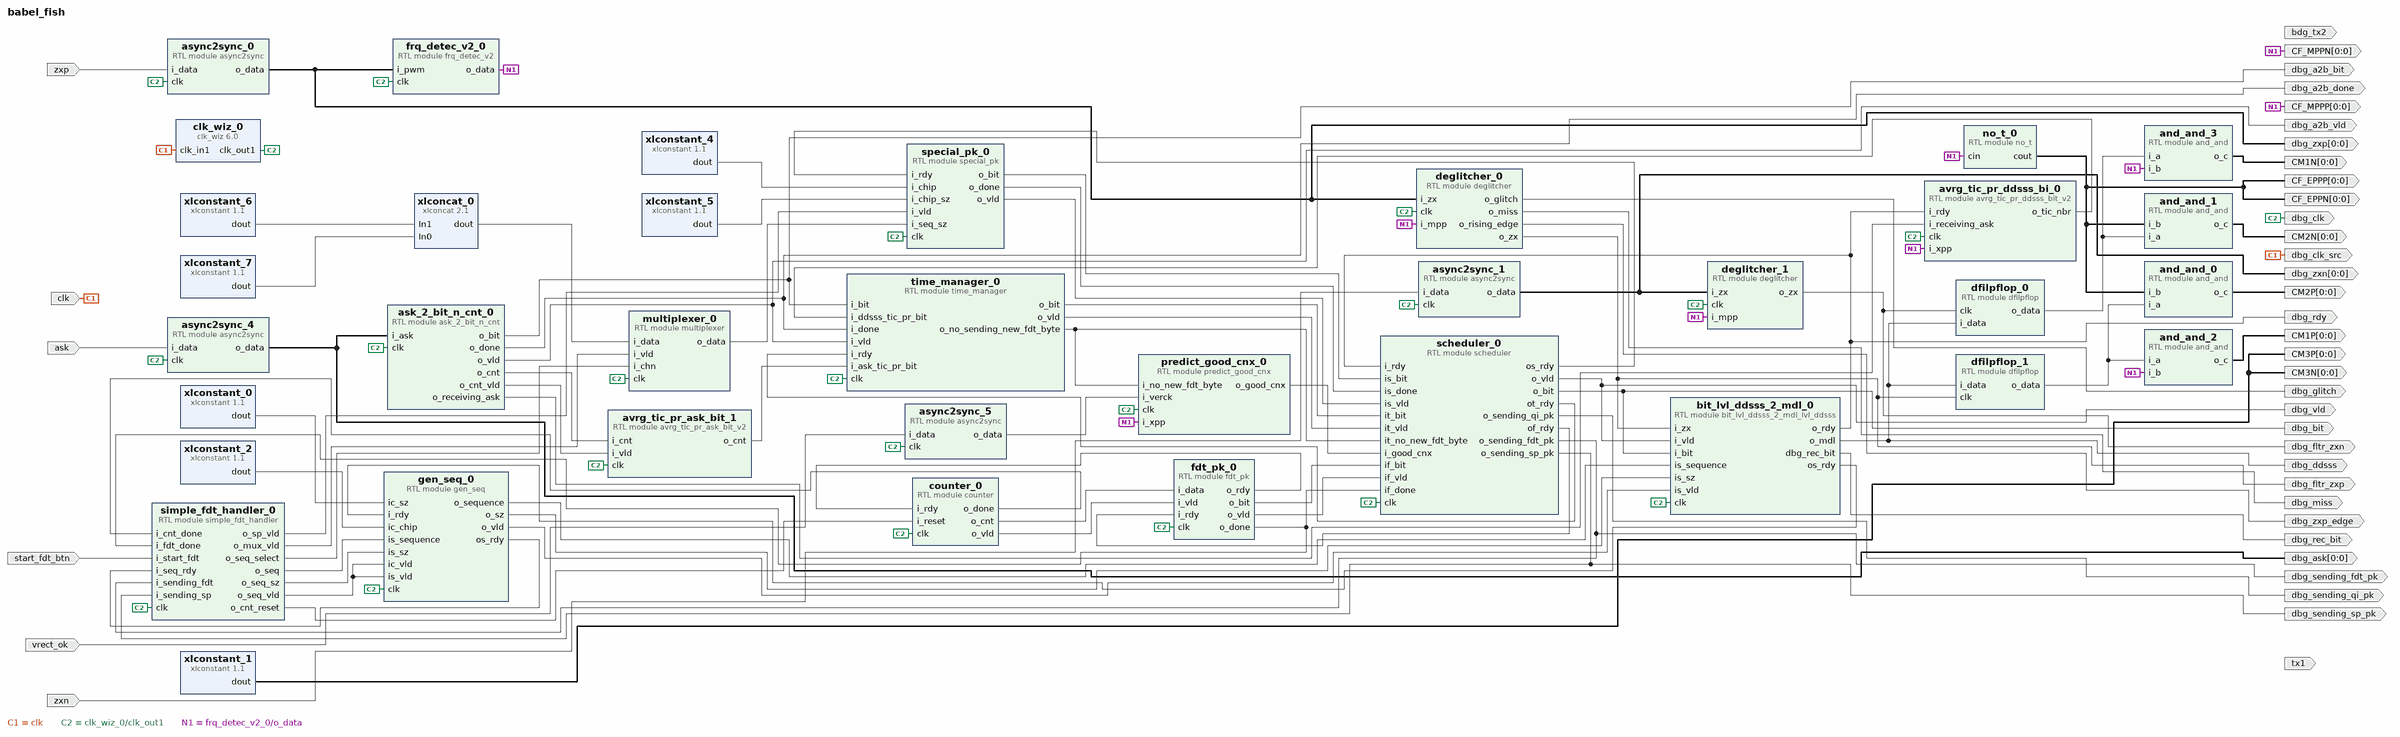
[diagram p0: block diagram of the top level]
# Vivado block design babel_fish, xc7a35tcpg236-1, Vivado 2021.1
create_bd_design babel_fish

create_bd_port -dir I -type clk clk
set_property -dict {CONFIG.FREQ_HZ 12000000} [get_bd_ports clk]
create_bd_port -dir I -type data ask
create_bd_port -dir I -type data zxn
create_bd_port -dir I -type data zxp
create_bd_port -dir O -from 0 -to 0 -type data CF_EPPN
create_bd_port -dir O -from 0 -to 0 -type data CF_MPPN
create_bd_port -dir O -from 0 -to 0 -type data CF_EPPP
create_bd_port -dir O -from 0 -to 0 -type data CF_MPPP
create_bd_port -dir O -from 0 -to 0 -type data CM3N
create_bd_port -dir O -from 0 -to 0 -type data CM2N
create_bd_port -dir O -from 0 -to 0 -type data CM1N
create_bd_port -dir O -from 0 -to 0 -type data CM3P
create_bd_port -dir O -from 0 -to 0 -type data CM2P
create_bd_port -dir O -from 0 -to 0 -type data CM1P
create_bd_port -dir O -type data dbg_ddsss
create_bd_port -dir O -type data dbg_bit
create_bd_port -dir O -type data dbg_vld
create_bd_port -dir O -type data dbg_clk
create_bd_port -dir O -from 0 -to 0 -type data dbg_ask
create_bd_port -dir O -type data dbg_clk_src
create_bd_port -dir O -from 0 -to 0 -type data dbg_zxp
create_bd_port -dir O -from 0 -to 0 -type data dbg_zxn
create_bd_port -dir O -type data dbg_rec_bit
create_bd_port -dir O -type data dbg_rdy
create_bd_port -dir O -type data dbg_fltr_zxp
create_bd_port -dir O -type data dbg_fltr_zxn
create_bd_port -dir O -type data dbg_glitch
create_bd_port -dir O -type data dbg_miss
create_bd_port -dir O -type data dbg_zxp_edge
create_bd_port -dir O -type data dbg_a2b_vld
create_bd_port -dir O -type data dbg_a2b_bit
create_bd_port -dir O -type data dbg_a2b_done
create_bd_port -dir O -type data tx1
create_bd_port -dir O -type data bdg_tx2
create_bd_port -dir I -type data vrect_ok
create_bd_port -dir I -type data start_fdt_btn
create_bd_port -dir O -type data dbg_sending_qi_pk
create_bd_port -dir O -type data dbg_sending_sp_pk
create_bd_port -dir O -type data dbg_sending_fdt_pk

create_bd_cell -type ip -vlnv xilinx.com:ip:clk_wiz:6.0 clk_wiz_0
set_property -dict [list \
  CONFIG.CLKIN1_JITTER_PS 833.33 \
  CONFIG.CLKOUT1_JITTER 479.872 \
  CONFIG.CLKOUT1_PHASE_ERROR 668.310 \
  CONFIG.MMCM_CLKFBOUT_MULT_F 62.500 \
  CONFIG.MMCM_CLKIN1_PERIOD 83.333 \
  CONFIG.MMCM_CLKIN2_PERIOD 10.0 \
  CONFIG.MMCM_CLKOUT0_DIVIDE_F 7.500 \
  CONFIG.PRIM_IN_FREQ 12 \
  CONFIG.USE_LOCKED false \
  CONFIG.USE_RESET false \
] [get_bd_cells clk_wiz_0]
create_bd_cell -type ip -vlnv xilinx.com:ip:xlconstant:1.1 xlconstant_1
set_property -dict {CONFIG.CONST_VAL 0} [get_bd_cells xlconstant_1]
create_bd_cell -type module -reference async2sync async2sync_0
set_property -dict {CONFIG.sync_level 5} [get_bd_cells async2sync_0]
create_bd_cell -type module -reference async2sync async2sync_1
set_property -dict {CONFIG.sync_level 5} [get_bd_cells async2sync_1]
create_bd_cell -type module -reference async2sync async2sync_4
set_property -dict {CONFIG.sync_level 5} [get_bd_cells async2sync_4]
create_bd_cell -type module -reference no_t no_t_0
create_bd_cell -type module -reference and_and and_and_0
create_bd_cell -type module -reference and_and and_and_1
create_bd_cell -type module -reference and_and and_and_2
create_bd_cell -type module -reference and_and and_and_3
create_bd_cell -type module -reference dfilpflop dfilpflop_0
set_property -dict {CONFIG.data_width 1} [get_bd_cells dfilpflop_0]
create_bd_cell -type module -reference dfilpflop dfilpflop_1
set_property -dict {CONFIG.data_width 1} [get_bd_cells dfilpflop_1]
create_bd_cell -type module -reference deglitcher deglitcher_0
create_bd_cell -type module -reference deglitcher deglitcher_1
create_bd_cell -type module -reference frq_detec_v2 frq_detec_v2_0
create_bd_cell -type module -reference ask_2_bit_n_cnt ask_2_bit_n_cnt_0
set_property -dict {CONFIG.cnt_width 16} [get_bd_cells ask_2_bit_n_cnt_0]
create_bd_cell -type module -reference avrg_tic_pr_ask_bit_v2 avrg_tic_pr_ask_bit_1
set_property -dict {CONFIG.cnt_width 16} [get_bd_cells avrg_tic_pr_ask_bit_1]
create_bd_cell -type module -reference avrg_tic_pr_ddsss_bit_v2 avrg_tic_pr_ddsss_bi_0
set_property -dict {CONFIG.output_width 16} [get_bd_cells avrg_tic_pr_ddsss_bi_0]
create_bd_cell -type module -reference time_manager time_manager_0
create_bd_cell -type module -reference fdt_pk fdt_pk_0
create_bd_cell -type module -reference counter counter_0
create_bd_cell -type ip -vlnv xilinx.com:ip:xlconstant:1.1 xlconstant_0
set_property -dict {CONFIG.CONST_VAL 2 CONFIG.CONST_WIDTH 8} [get_bd_cells xlconstant_0]
create_bd_cell -type ip -vlnv xilinx.com:ip:xlconstant:1.1 xlconstant_2
set_property -dict {CONFIG.CONST_VAL 1 CONFIG.CONST_WIDTH 2} [get_bd_cells xlconstant_2]
create_bd_cell -type ip -vlnv xilinx.com:ip:xlconstant:1.1 xlconstant_4
set_property -dict {CONFIG.CONST_VAL 2 CONFIG.CONST_WIDTH 16} [get_bd_cells xlconstant_4]
create_bd_cell -type ip -vlnv xilinx.com:ip:xlconstant:1.1 xlconstant_5
set_property -dict {CONFIG.CONST_VAL 2 CONFIG.CONST_WIDTH 8} [get_bd_cells xlconstant_5]
create_bd_cell -type module -reference multiplexer multiplexer_0
set_property -dict {CONFIG.address_width 1 CONFIG.channel_number 2 CONFIG.data_width 8} [get_bd_cells multiplexer_0]
create_bd_cell -type module -reference async2sync async2sync_5
set_property -dict {CONFIG.sync_level 5} [get_bd_cells async2sync_5]
create_bd_cell -type ip -vlnv xilinx.com:ip:xlconstant:1.1 xlconstant_6
set_property -dict {CONFIG.CONST_VAL 8 CONFIG.CONST_WIDTH 8} [get_bd_cells xlconstant_6]
create_bd_cell -type ip -vlnv xilinx.com:ip:xlconstant:1.1 xlconstant_7
set_property -dict {CONFIG.CONST_VAL 32 CONFIG.CONST_WIDTH 8} [get_bd_cells xlconstant_7]
create_bd_cell -type ip -vlnv xilinx.com:ip:xlconcat:2.1 xlconcat_0
set_property -dict {CONFIG.IN0_WIDTH 8 CONFIG.IN1_WIDTH 8} [get_bd_cells xlconcat_0]
create_bd_cell -type module -reference special_pk special_pk_0
create_bd_cell -type module -reference predict_good_cnx predict_good_cnx_0
create_bd_cell -type module -reference simple_fdt_handler simple_fdt_handler_0
create_bd_cell -type module -reference bit_lvl_ddsss_2_mdl_lvl_ddsss bit_lvl_ddsss_2_mdl_0
set_property -dict {CONFIG.mdl_lvl_max_sequece_width 64} [get_bd_cells bit_lvl_ddsss_2_mdl_0]
create_bd_cell -type module -reference scheduler scheduler_0
create_bd_cell -type module -reference gen_seq gen_seq_0

# ---- connections ----

connect_bd_net [get_bd_pins and_and_0/o_c] [get_bd_ports CM2P]
connect_bd_net [get_bd_pins and_and_1/o_c] [get_bd_ports CM2N]
connect_bd_net [get_bd_pins and_and_2/o_c] [get_bd_ports CM1P]
connect_bd_net [get_bd_pins and_and_3/o_c] [get_bd_ports CM1N]
connect_bd_net [get_bd_ports ask] [get_bd_pins async2sync_4/i_data]
connect_bd_net -net ask_2_bit_0_o_bit [get_bd_pins ask_2_bit_n_cnt_0/o_bit] [get_bd_ports dbg_a2b_bit] [get_bd_pins time_manager_0/i_bit]
connect_bd_net -net ask_2_bit_0_o_done [get_bd_pins ask_2_bit_n_cnt_0/o_done] [get_bd_ports dbg_a2b_done] [get_bd_pins time_manager_0/i_done]
connect_bd_net -net ask_2_bit_0_o_vld [get_bd_pins ask_2_bit_n_cnt_0/o_vld] [get_bd_ports dbg_a2b_vld] [get_bd_pins time_manager_0/i_vld]
connect_bd_net [get_bd_pins ask_2_bit_n_cnt_0/o_cnt] [get_bd_pins avrg_tic_pr_ask_bit_1/i_cnt]
connect_bd_net [get_bd_pins ask_2_bit_n_cnt_0/o_cnt_vld] [get_bd_pins avrg_tic_pr_ask_bit_1/i_vld]
connect_bd_net [get_bd_pins ask_2_bit_n_cnt_0/o_receiving_ask] [get_bd_pins avrg_tic_pr_ddsss_bi_0/i_receiving_ask]
connect_bd_net -net ask_2_ddsss_manager_0_o_vld [get_bd_pins scheduler_0/o_vld] [get_bd_ports dbg_vld] [get_bd_pins bit_lvl_ddsss_2_mdl_0/i_vld]
connect_bd_net [get_bd_pins async2sync_0/o_data] [get_bd_ports dbg_zxp] [get_bd_pins deglitcher_0/i_zx] [get_bd_pins frq_detec_v2_0/i_pwm]
connect_bd_net [get_bd_pins async2sync_1/o_data] [get_bd_ports dbg_zxn] [get_bd_pins deglitcher_1/i_zx]
connect_bd_net [get_bd_pins async2sync_4/o_data] [get_bd_ports dbg_ask] [get_bd_pins ask_2_bit_n_cnt_0/i_ask]
connect_bd_net [get_bd_pins async2sync_5/o_data] [get_bd_pins predict_good_cnx_0/i_verck]
connect_bd_net -net avrg_tic_pr_ask_bit_0_o_tic_nbr [get_bd_pins avrg_tic_pr_ask_bit_1/o_cnt] [get_bd_pins time_manager_0/i_ask_tic_pr_bit]
connect_bd_net -net avrg_tic_pr_ddsss_bit_0_o_tic_nbr [get_bd_pins avrg_tic_pr_ddsss_bi_0/o_tic_nbr] [get_bd_pins time_manager_0/i_ddsss_tic_pr_bit]
connect_bd_net [get_bd_pins bit_lvl_ddsss_2_mdl_0/dbg_rec_bit] [get_bd_ports dbg_rec_bit]
connect_bd_net [get_bd_pins bit_lvl_ddsss_2_mdl_0/o_mdl] [get_bd_ports dbg_ddsss] [get_bd_pins dfilpflop_0/i_data] [get_bd_pins dfilpflop_1/i_data]
connect_bd_net [get_bd_pins bit_lvl_ddsss_2_mdl_0/o_rdy] \
  [get_bd_ports dbg_rdy] [get_bd_pins avrg_tic_pr_ddsss_bi_0/i_rdy] [get_bd_pins scheduler_0/i_rdy]
connect_bd_net [get_bd_pins bit_lvl_ddsss_2_mdl_0/os_rdy] [get_bd_pins gen_seq_0/i_rdy]
connect_bd_net [get_bd_ports clk] [get_bd_pins clk_wiz_0/clk_in1] [get_bd_ports dbg_clk_src]
connect_bd_net [get_bd_pins clk_wiz_0/clk_out1] \
  [get_bd_pins async2sync_0/clk] [get_bd_pins async2sync_1/clk] [get_bd_pins async2sync_4/clk] [get_bd_ports dbg_clk] \
  [get_bd_pins deglitcher_0/clk] [get_bd_pins deglitcher_1/clk] [get_bd_pins frq_detec_v2_0/clk] \
  [get_bd_pins ask_2_bit_n_cnt_0/clk] [get_bd_pins avrg_tic_pr_ask_bit_1/clk] [get_bd_pins avrg_tic_pr_ddsss_bi_0/clk] \
  [get_bd_pins time_manager_0/clk] [get_bd_pins fdt_pk_0/clk] [get_bd_pins counter_0/clk] [get_bd_pins multiplexer_0/clk] \
  [get_bd_pins async2sync_5/clk] [get_bd_pins special_pk_0/clk] [get_bd_pins predict_good_cnx_0/clk] \
  [get_bd_pins simple_fdt_handler_0/clk] [get_bd_pins bit_lvl_ddsss_2_mdl_0/clk] [get_bd_pins scheduler_0/clk] \
  [get_bd_pins gen_seq_0/clk]
connect_bd_net [get_bd_pins counter_0/o_cnt] [get_bd_pins fdt_pk_0/i_data]
connect_bd_net [get_bd_pins counter_0/o_done] [get_bd_pins simple_fdt_handler_0/i_cnt_done]
connect_bd_net [get_bd_pins counter_0/o_vld] [get_bd_pins fdt_pk_0/i_vld]
connect_bd_net [get_bd_pins deglitcher_0/o_glitch] [get_bd_ports dbg_glitch]
connect_bd_net [get_bd_pins deglitcher_0/o_miss] [get_bd_ports dbg_miss]
connect_bd_net [get_bd_pins deglitcher_0/o_rising_edge] [get_bd_ports dbg_zxp_edge]
connect_bd_net [get_bd_pins deglitcher_0/o_zx] [get_bd_pins dfilpflop_1/clk] [get_bd_ports dbg_fltr_zxp] [get_bd_pins bit_lvl_ddsss_2_mdl_0/i_zx]
connect_bd_net [get_bd_pins deglitcher_1/o_zx] [get_bd_pins dfilpflop_0/clk] [get_bd_ports dbg_fltr_zxn]
connect_bd_net [get_bd_pins dfilpflop_0/o_data] [get_bd_pins and_and_1/i_a] [get_bd_pins and_and_3/i_a]
connect_bd_net [get_bd_pins dfilpflop_1/o_data] [get_bd_pins and_and_0/i_a] [get_bd_pins and_and_2/i_a]
connect_bd_net [get_bd_pins fdt_pk_0/o_bit] [get_bd_pins scheduler_0/if_bit]
connect_bd_net [get_bd_pins fdt_pk_0/o_done] [get_bd_pins simple_fdt_handler_0/i_fdt_done] [get_bd_pins scheduler_0/if_done]
connect_bd_net [get_bd_pins fdt_pk_0/o_rdy] [get_bd_pins counter_0/i_rdy]
connect_bd_net [get_bd_pins fdt_pk_0/o_vld] [get_bd_pins scheduler_0/if_vld]
connect_bd_net -net frq_dectector_0_o_data [get_bd_pins frq_detec_v2_0/o_data] \
  [get_bd_ports CF_MPPN] [get_bd_ports CF_MPPP] [get_bd_pins no_t_0/cin] [get_bd_pins and_and_2/i_b] \
  [get_bd_pins and_and_3/i_b] [get_bd_pins deglitcher_0/i_mpp] [get_bd_pins deglitcher_1/i_mpp] \
  [get_bd_pins avrg_tic_pr_ddsss_bi_0/i_xpp] [get_bd_pins predict_good_cnx_0/i_xpp]
connect_bd_net [get_bd_pins gen_seq_0/o_sequence] [get_bd_pins bit_lvl_ddsss_2_mdl_0/is_sequence]
connect_bd_net [get_bd_pins gen_seq_0/o_sz] [get_bd_pins bit_lvl_ddsss_2_mdl_0/is_sz]
connect_bd_net [get_bd_pins gen_seq_0/o_vld] [get_bd_pins bit_lvl_ddsss_2_mdl_0/is_vld]
connect_bd_net [get_bd_pins gen_seq_0/os_rdy] [get_bd_pins simple_fdt_handler_0/i_seq_rdy]
connect_bd_net [get_bd_pins multiplexer_0/o_data] [get_bd_pins special_pk_0/i_seq_sz]
connect_bd_net -net parallel_2_serial_0_o_bit [get_bd_pins scheduler_0/o_bit] [get_bd_ports dbg_bit] [get_bd_pins bit_lvl_ddsss_2_mdl_0/i_bit]
connect_bd_net [get_bd_pins predict_good_cnx_0/o_good_cnx] [get_bd_pins scheduler_0/i_good_cnx]
connect_bd_net [get_bd_pins scheduler_0/o_sending_fdt_pk] [get_bd_ports dbg_sending_fdt_pk] [get_bd_pins simple_fdt_handler_0/i_sending_fdt]
connect_bd_net [get_bd_pins scheduler_0/o_sending_qi_pk] [get_bd_ports dbg_sending_qi_pk]
connect_bd_net [get_bd_pins scheduler_0/o_sending_sp_pk] [get_bd_ports dbg_sending_sp_pk] [get_bd_pins simple_fdt_handler_0/i_sending_sp]
connect_bd_net [get_bd_pins scheduler_0/of_rdy] [get_bd_pins fdt_pk_0/i_rdy]
connect_bd_net [get_bd_pins scheduler_0/os_rdy] [get_bd_pins special_pk_0/i_rdy]
connect_bd_net [get_bd_pins scheduler_0/ot_rdy] [get_bd_pins time_manager_0/i_rdy]
connect_bd_net [get_bd_pins simple_fdt_handler_0/o_cnt_reset] [get_bd_pins counter_0/i_reset]
connect_bd_net [get_bd_pins simple_fdt_handler_0/o_mux_vld] [get_bd_pins multiplexer_0/i_vld]
connect_bd_net [get_bd_pins simple_fdt_handler_0/o_seq] [get_bd_pins gen_seq_0/is_sequence]
connect_bd_net [get_bd_pins simple_fdt_handler_0/o_seq_select] [get_bd_pins multiplexer_0/i_chn]
connect_bd_net [get_bd_pins simple_fdt_handler_0/o_seq_sz] [get_bd_pins gen_seq_0/is_sz]
connect_bd_net [get_bd_pins simple_fdt_handler_0/o_seq_vld] [get_bd_pins gen_seq_0/is_vld] [get_bd_pins gen_seq_0/ic_vld]
connect_bd_net [get_bd_pins simple_fdt_handler_0/o_sp_vld] [get_bd_pins special_pk_0/i_vld]
connect_bd_net [get_bd_pins special_pk_0/o_bit] [get_bd_pins scheduler_0/is_bit]
connect_bd_net [get_bd_pins special_pk_0/o_done] [get_bd_pins scheduler_0/is_done]
connect_bd_net [get_bd_pins special_pk_0/o_vld] [get_bd_pins scheduler_0/is_vld]
connect_bd_net [get_bd_ports start_fdt_btn] [get_bd_pins simple_fdt_handler_0/i_start_fdt]
connect_bd_net [get_bd_pins time_manager_0/o_bit] [get_bd_pins scheduler_0/it_bit]
connect_bd_net [get_bd_pins time_manager_0/o_no_sending_new_fdt_byte] \
  [get_bd_pins predict_good_cnx_0/i_no_new_fdt_byte] [get_bd_pins scheduler_0/it_no_new_fdt_byte]
connect_bd_net [get_bd_pins time_manager_0/o_vld] [get_bd_pins scheduler_0/it_vld]
connect_bd_net [get_bd_ports vrect_ok] [get_bd_pins async2sync_5/i_data]
connect_bd_net [get_bd_pins xlconcat_0/dout] [get_bd_pins multiplexer_0/i_data]
connect_bd_net -net xlconstant_0_dout [get_bd_pins no_t_0/cout] \
  [get_bd_ports CF_EPPN] [get_bd_ports CF_EPPP] [get_bd_pins and_and_0/i_b] [get_bd_pins and_and_1/i_b]
connect_bd_net [get_bd_pins xlconstant_0/dout] [get_bd_pins gen_seq_0/ic_sz]
connect_bd_net [get_bd_pins xlconstant_1/dout] [get_bd_ports CM3N] [get_bd_ports CM3P]
connect_bd_net [get_bd_pins xlconstant_2/dout] [get_bd_pins gen_seq_0/ic_chip]
connect_bd_net [get_bd_pins xlconstant_4/dout] [get_bd_pins special_pk_0/i_chip]
connect_bd_net [get_bd_pins xlconstant_5/dout] [get_bd_pins special_pk_0/i_chip_sz]
connect_bd_net [get_bd_pins xlconstant_6/dout] [get_bd_pins xlconcat_0/In1]
connect_bd_net [get_bd_pins xlconstant_7/dout] [get_bd_pins xlconcat_0/In0]
connect_bd_net [get_bd_ports zxn] [get_bd_pins async2sync_1/i_data]
connect_bd_net [get_bd_ports zxp] [get_bd_pins async2sync_0/i_data]

validate_bd_design
save_bd_design
